# Altium schematic sheet Connectors.SchDoc
size A; SheetNumber: 2; SheetTotal: 4
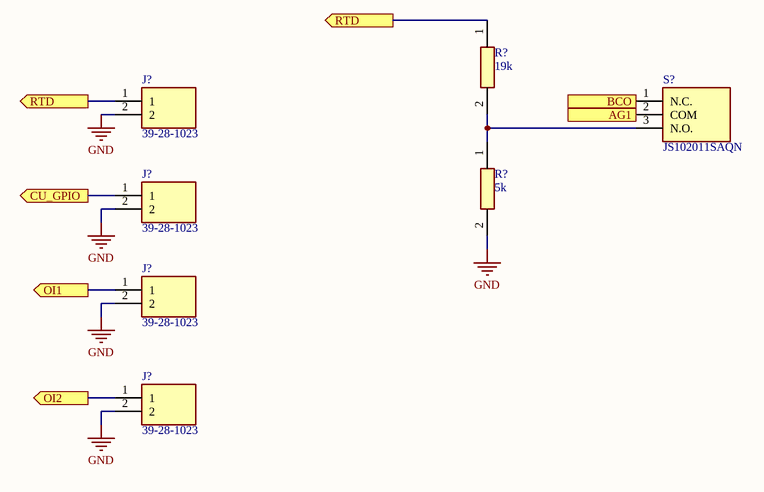
[diagram p0: Connectors.SchDoc]

## Parts
(Parts that share a designator on the sheet are numbered #1, #2 ... from top to bottom, then left to right.)
J?#1  39-28-1023  [39-28-1023]
J?#2  39-28-1023  [39-28-1023]
J?#3  39-28-1023  [39-28-1023]
J?#4  39-28-1023  [39-28-1023]
R?#1  19k  [RESC5025X88N]
R?#2  5k  [RESC5025X88N]
S?  JS102011SAQN  [JS102011SAQN]

## Ports
AG1 (out), BCO (out), CU_GPIO (out), OI1 (out), OI2 (out), RTD (out)

## Nets
GND: J?#1.2 J?#2.2 J?#3.2 J?#4.2 R?#2.2
AG1: S?.2(COM) ; port AG1
BCO: S?.1(N.C.) ; port BCO
CU_GPIO: J?#2.1 ; port CU_GPIO
OI1: J?#3.1 ; port OI1
OI2: J?#4.1 ; port OI2
RTD: J?#1.1 R?#1.1 ; port RTD
NetR?#1_2: R?#1.2 R?#2.1 S?.3(N.O.)

## Library data of the parts
J?#1-J?#4 = 39-28-1023: Connector; Manufacturer_Name: Molex; Datasheet Link: https://www.molex.com/pdm_docs/sd/039281023_sd.pdf; Height: 12.8mm; Manufacturer_Part_Number: 39-28-1023; Mouser Part Number: 538-39-28-1023; Mouser Price/Stock: https://www.mouser.co.uk/ProductDetail/Molex/39-28-1023?qs=LQQHZ4xw2XBykFU0jRHvlQ%3D%3D; Arrow Part Number: 39-28-1023; Arrow Price/Stock: https://www.arrow.com/en/products/39-28-1023/molex?region=nac
R?#1 R?#2 = WSL2010R2500FEA: Resistor; Manufacturer_Name: Vishay; Datasheet Link: http://componentsearchengine.com/Datasheets/1/WSL2010R2500FEA.pdf; Manufacturer_Part_Number: WSL2010R2500FEA; Mouser Part Number: 71-WSL2010R2500FEA; Mouser Price/Stock: https://www.mouser.co.uk/ProductDetail/Vishay-Dale/WSL2010R2500FEA?qs=IZrxGxQQvkPiYWdpItF4Pg%3D%3D; Arrow Part Number: WSL2010R2500FEA; Arrow Price/Stock: https://www.arrow.com/en/products/wsl2010r2500fea/vishay
S? = JS102011SAQN: Switch; Manufacturer_Name: LITTELFUSE; Datasheet Link: https://www.littelfuse.com/assetdocs/littelfuse-ck-slide-js-series-datasheet?assetguid=aba42b08-0d2c-423b-813d-a2faa5a3bb14; Height: 3.5mm; Manufacturer_Part_Number: JS102011SAQN; Mouser Part Number: 611-JS102011SAQN; Mouser Price/Stock: https://www.mouser.co.uk/ProductDetail/CK/JS102011SAQN?qs=LgMIjt8LuD%252B69bNM9a%2FozQ%3D%3D; Arrow Part Number: JS102011SAQN; Arrow Price/Stock: https://www.arrow.com/en/products/js102011saqn/littelfuse.html?utm_currency=USD&region=nac